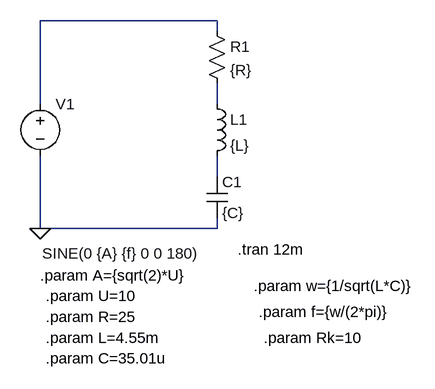
[diagram p0: schematic LAB2.5.asc]
LAB2.5.asc, the LTspice schematic file:
Version 4.1
SHEET 1 928 680
WIRE 272 -144 0 -144
WIRE 272 -128 272 -144
WIRE 0 -16 0 -144
WIRE 272 -16 272 -48
WIRE 272 96 272 64
WIRE 0 176 0 64
WIRE 272 176 272 160
WIRE 272 176 0 176
FLAG 0 176 0
SYMBOL res 256 -144 R0
SYMATTR InstName R1
SYMATTR Value {R}
SYMBOL ind 256 -32 R0
SYMATTR InstName L1
SYMATTR Value {L}
SYMATTR SpiceLine Rser={Rk}
SYMBOL cap 256 96 R0
SYMATTR InstName C1
SYMATTR Value {C}
SYMBOL users\\root\\AppData\\Local\\LTspice\\lib\\sym\\voltage 0 -32 R0
WINDOW 3 3 246 Left 2
WINDOW 123 0 0 Left 0
WINDOW 39 0 0 Left 0
SYMATTR InstName V1
SYMATTR Value SINE(0 {A} {f} 0 0 180)
TEXT 0 248 Left 2 !.param A={sqrt(2)*U}
TEXT 8 280 Left 2 !.param U=10
TEXT 8 312 Left 2 !.param R=25
TEXT 8 344 Left 2 !.param L=4.55m
TEXT 8 376 Left 2 !.param C=35.01u
TEXT 304 208 Left 2 !.tran 12m
TEXT 328 264 Left 2 !.param w={1/sqrt(L*C)}
TEXT 336 304 Left 2 !.param f={w/(2*pi)}
TEXT 344 344 Left 2 !.param Rk=10

The netlist it stands for:
* LAB2.5.asc
R1 N001 N002 {R}
L1 N002 N003 {L} Rser={Rk}
C1 N003 0 {C}
V1 N001 0 SINE(0 {A} {f} 0 0 180)
.param A={sqrt(2)*U}
.param U=10
.param R=25
.param L=4.55m
.param C=35.01u
.tran 12m
.param w={1/sqrt(L*C)}
.param f={w/(2*pi)}
.param Rk=10
.backanno
.end